# Altium schematic sheet INTERFACES.SchDoc
size A4; SheetNumber: 6; SheetTotal: 6
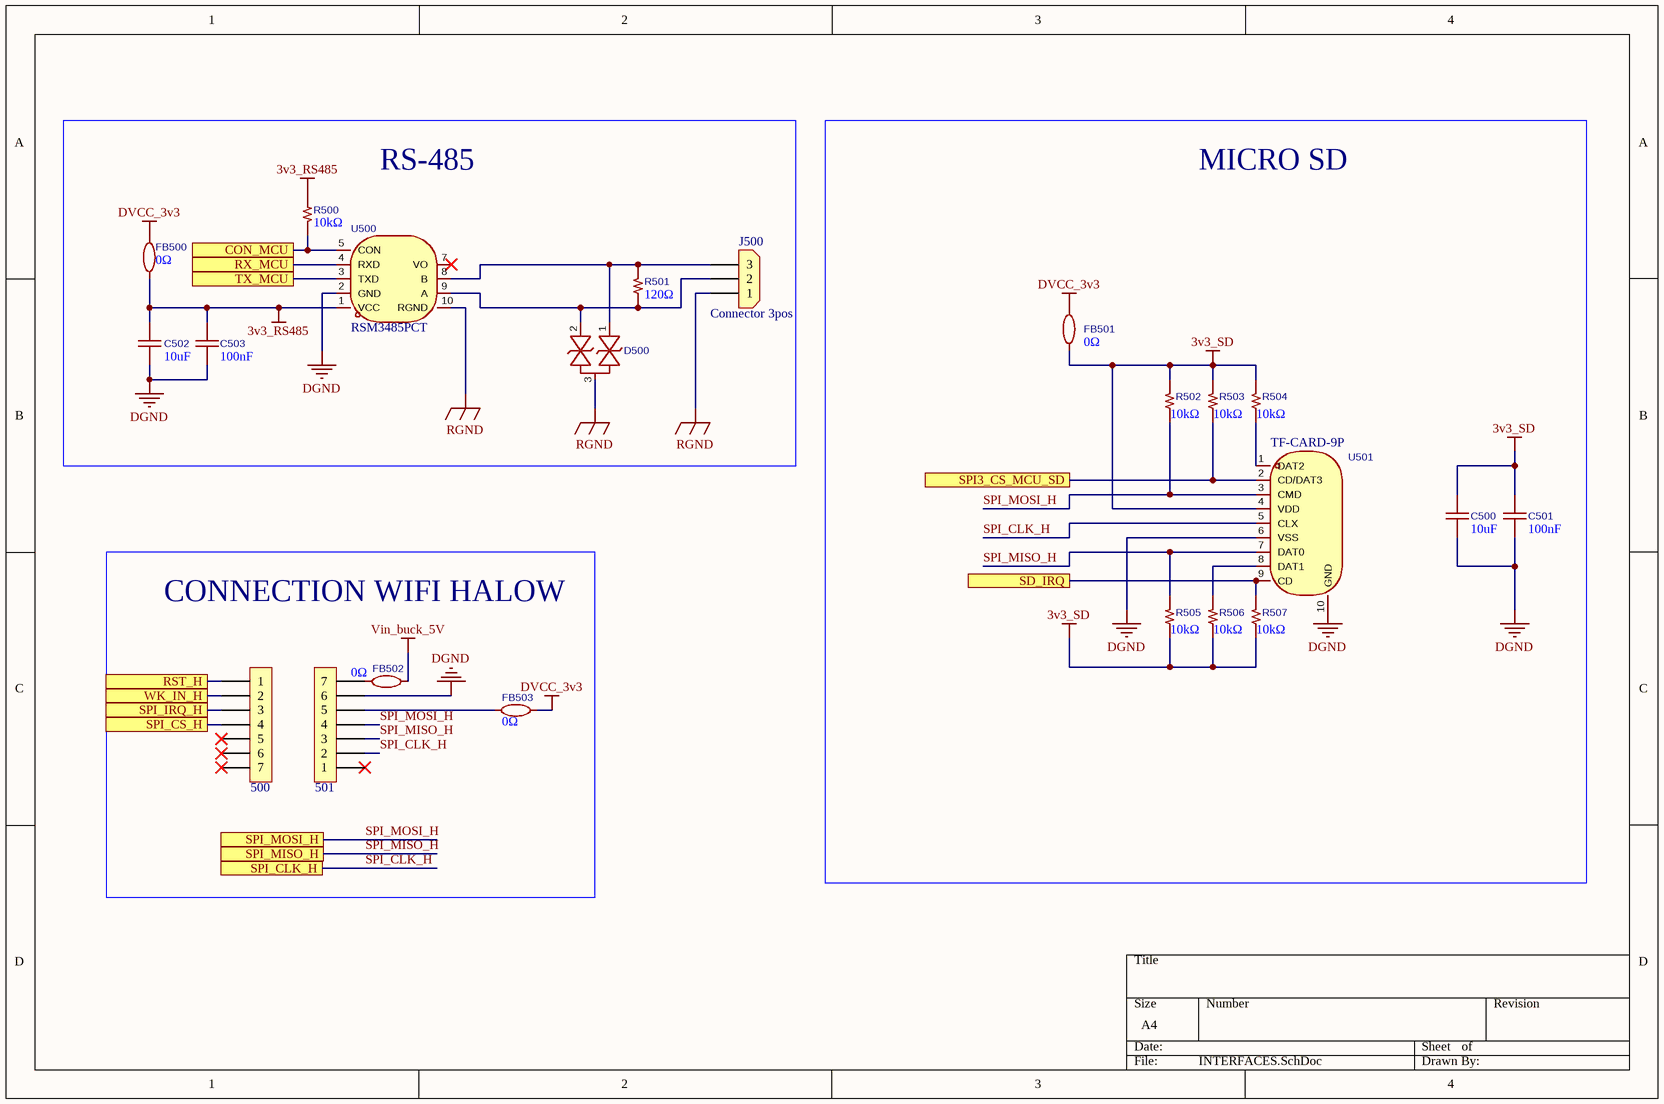
[diagram p0: INTERFACES.SchDoc]

## Parts
500  7x1  [H_7x1_TH_100mil]  (value not drawn)  (no BOM)
501  7x1  [H_7x1_TH_100mil]  (value not drawn)  (no BOM)
C500  value 10uF  [0805_cap]  (hidden comment: muRata GRM21BR61C106KE15L)
C501  value 100nF  [0603_cap]  (hidden comment: AIDE CAPACITOR 0603X7R104K250NT)
C502  value 10uF  [0805_cap]  (hidden comment: muRata GRM21BR61C106KE15L)
C503  value 100nF  [0603_cap]  (hidden comment: AIDE CAPACITOR 0603X7R104K250NT)
D500  C908219  [SOT-23-3_L2.9-W1.3-P1.90-LS2.4-BR]  (value not drawn)
FB500  value 0Ω  [0603_cap]  (hidden comment: Yanchuang SCBM160808U090T)
FB501  value 0Ω  [0603_cap]  (hidden comment: Yanchuang SCBM160808U090T)
FB502  value 0Ω  [0603_cap]  (hidden comment: Yanchuang SCBM160808U090T)
FB503  value 0Ω  [0603_cap]  (hidden comment: Yanchuang SCBM160808U090T)
J500  Connector 3pos  [CON_3x1_TH_5mm]
R500  value 10kΩ  [0603_RES]  (hidden comment: SAE 1RC0603F1002)
R501  value 120Ω  [0603_RES]  (hidden comment: RES 120Ω ±1% 100mW 0603)
R502  value 10kΩ  [0603_RES]  (hidden comment: SAE 1RC0603F1002)
R503  value 10kΩ  [0603_RES]  (hidden comment: SAE 1RC0603F1002)
R504  value 10kΩ  [0603_RES]  (hidden comment: SAE 1RC0603F1002)
R505  value 10kΩ  [0603_RES]  (hidden comment: SAE 1RC0603F1002)
R506  value 10kΩ  [0603_RES]  (hidden comment: SAE 1RC0603F1002)
R507  value 10kΩ  [0603_RES]  (hidden comment: SAE 1RC0603F1002)
U500  rsm3485pct  [COMM-TH_RSM3485PCT]
U501  tf-card-9p  [SIM-SMD_LX_XDFP-0090-012]

## Blocks framed on the sheet
RS-485: C502 C503 D500 FB500 J500 R500 R501 U500
MICRO SD: C500 C501 FB501 R502-R507 U501
CONNECTION WIFI HALOW: 500 501 FB502 FB503

## Ports
CON_MCU (see MAIN[3B], MCU[2B]), RST_H (see MAIN[3B], MCU[2B]), RX_MCU (see MAIN[3B], MCU[2B]), SD_IRQ (see MAIN[3B], MCU[2C]), SPI3_CS_MCU_SD (see MAIN[3C], MCU[3B]), SPI_CLK_H (see MAIN[3B], MCU[2C]), SPI_CS_H (see MAIN[3B], MCU[2C]), SPI_IRQ_H (see MAIN[3C], MCU[2B]), SPI_MISO_H (see MAIN[3B], MCU[3C]), SPI_MOSI_H (see MAIN[3B], MCU[2C]), TX_MCU (see MAIN[3B], MCU[2B]), WK_IN_H (see MAIN[3B], MCU[2B])

## Nets
3v3_RS485: C502.2 C503.2 FB500.1 R500.1 U500.1(VCC)
3v3_SD: C500.2 C501.2 FB501.1 R502.2 R503.2 R504.2 R505.1 R506.1 R507.1 U501.4(VDD)
DGND: 501.6 C500.1 C501.1 C502.1 C503.1 U500.2(GND) U501.6(VSS) U501.10(GND)
DVCC_3v3: FB500.2 FB501.2 FB503.1
RGND: D500.3 J500.1 U500.10(RGND)
Vin_buck_5V: FB502.1
CON_MCU: R500.2 U500.5(CON) ; port CON_MCU
RST_H: 500.1 ; port RST_H
RX_MCU: U500.4(RXD) ; port RX_MCU
SD_IRQ: R507.2 U501.9(CD) ; port SD_IRQ
SPI3_CS_MCU_SD: R503.1 U501.2(CD/DAT3) ; port SPI3_CS_MCU_SD
SPI_CLK_H: 501.2 U501.5(CLX) ; port SPI_CLK_H
SPI_CS_H: 500.4 ; port SPI_CS_H
SPI_IRQ_H: 500.3 ; port SPI_IRQ_H
SPI_MISO_H: 501.3 R505.2 U501.7(DAT0) ; port SPI_MISO_H
SPI_MOSI_H: 501.4 R502.1 U501.3(CMD) ; port SPI_MOSI_H
TX_MCU: U500.3(TXD) ; port TX_MCU
WK_IN_H: 500.2 ; port WK_IN_H
Net501_5: 501.5 FB503.2
Net501_7: 501.7 FB502.2
NetD500_1: D500.1 J500.3 R501.2 U500.8(B)
NetD500_2: D500.2 J500.2 R501.1 U500.9(A)
NetR504_1: R504.1 U501.1(DAT2)
NetR506_2: R506.2 U501.8(DAT1)

Not connected (* = marked no-connect by the designer): 500 5* 6* 7*; 501 1*; U500 7(VO)*

## Library data of the parts
500 501 = H_Male_7x1_TH_100mil: ComponentLink1Description: LCSC
C500 C502 = CAP CER 10uF 16V X5R 0805: ComponentLink1Description: New link; ComponentLink1URL: https://www.lcsc.com/es/product-detail/C77075.html?spm=wm.fly.bg.11.xh___wm.fly.dhl.mly.13-0-3&lcsc_vid=ElBYBFACR1JaVQdSQ1NeBFwHFAdfUFIFEwUNXlwCEVQxVlNfRlVWUFNWT1hWUDtW; Manufacturer 1: muRata; Manufacturer Part Number 1: GRM21BR61C106KE15L; Supplier Part Number 1: C77075; Supplier 1: LCSC
C501 C503 = CAP CER 100nF 25V X7R 0603: ComponentLink1Description: LCSC; ComponentLink1URL: https://www.lcsc.com/product-detail/C465156.html?s_z=n_q_HGC0603G0150J500NTHJ; Supplier 1: LCSC; Manufacturer 1: AIDE CAPACITOR; Manufacturer Part Number 1: 0603X7R104K250NT; Supplier Part Number 1: C48579280
D500 = sm712_c908219_RS485: Polarity:Bidirectional Reverse Stand-Off Voltage (Vrwm):7V Clamping Voltage:20V Peak Pulse Current (Ipp):18A Peak Pulse Power Dissipation (Ppp):360W Voltage - Breakdown:13.3V Reverse Leakage Current (Ir):1uA Number of Channels:2 Operating Temperature:-55℃; Manufacturer 1: FUXINSEMI; Manufacturer Part Number 1: SM712; ComponentLink1Description: New link; ComponentLink1URL: https://www.lcsc.com/es/product-detail/C908219.html?s_z=n_q_p_sm712_c908219&spm=wm.ssy.bg.0.xh&lcsc_vid=FFRdVwAETgNbVwAHTlRdV1UFEwcIU1ZXQVZZAlYFQAcxVlNfRlJdUlJTQlRWXjsOAxUeFF5JWBYZEEoKFBINSQcJGk4LFEsWBQ4KEgcSWgULEwUPG04tVVZVT1BdXlVIHxUDCw%3D%3D; Supplier Part Number 1: C908219; Supplier 1: LCSC
FB500-FB503 = FERR_10mohms 15o@100MHz: 10mΩ 15Ω@100MHz 0603 Ferrite Beads and Chips; ComponentLink1Description: LCSC; ComponentLink1URL: https://www.lcsc.com/es/product-detail/C52205324.html?s_z=s_c_Ferrite%2520Beads%2520and%2520Chips&spm=wm.fly.bg.0.xh&lcsc_vid=T1EMUlBeR1ALUlVSFANeUFcFR1BWV1EHFVFaA1dQElAxVlNfRlJaVFNSQlhYUjsOAxUeFF5JWBYZEEoKFBINSQcJGk4LFEsFFhULAAsUDk5fVlNWWQkaCgg%3D; Supplier 1: LCSC; Supplier Part Number 1: C52205324; Manufacturer 1: Yanchuang; Manufacturer Part Number 1: SCBM160808U090T
J500 = Con_3x1_TH_5mm: 1x3P 10A -40℃~+105℃ 300V Green 14~26 Through Hole 5mm 2.5 1 3 Plugin,P=5mm Screw Terminal Blocks ROHS; Manufacturer 1: MAX; Manufacturer Part Number 1: MX126-5.0-03P-GN01-Cu-S-A; Supplier 1: LCSC; Supplier Part Number 1: C5188435; ComponentLink1Description: Digi-Key; ComponentLink1URL: https://lcsc.com/product-detail/Screw-Terminal-Blocks_MAX-MX126-5-0-03P-GN01-Cu-S-A_C5188435.html
R500 R502-R507 = RES_10kohms 100mW 75V: 10kΩ 100mW 75V Thick Film Resistor ±100ppm/℃ ±1% 0603 Chip Resistor - Surface Mount; ComponentLink1Description: New link; ComponentLink1URL: https://www.lcsc.com/es/product-detail/C53224186.html?spm=wm.fly.bg.4.xh___wm.fly.dhl.mly.13-6-1&lcsc_vid=T1EMUlBeR1ALUlVSFANeUFcFR1BWV1EHFVFaA1dQElAxVlNfRlJaV1FUQldbXzsOAxUeFF5JWBYZEEoKFBINSQcJGk4NBhYS; Manufacturer 1: SAE; Manufacturer Part Number 1: 1RC0603F1002; Supplier Part Number 1: C53224186; Supplier 1: LCSC
R501 = RES 120ohms 100mW150V Thick Film Resistor  ±100ppm 0805: Manufacturer 1: HWA CHN; Manufacturer Part Number 1: HRC0805F1200FNTN; ComponentLink1Description: New link; ComponentLink1URL: https://www.lcsc.com/product-detail/C48996813.html; Supplier Part Number 1: C54921099; Supplier 1: LCSC
U500 = RS485_RSM3485PCT: Data Rate:9.6Kbps ESD Protect:Yes Voltage - Supply:3.15V~3.45V Voltage - Supply:3.15V~3.45V isolation:2500V Number of Nodes:64 Quiescent Current:30mA Automatic flow control:No Operating Temperature:-40℃~+85℃ Operating Temperature:-40℃~+85℃; Manufacturer 1: VISOM; ComponentLink1Description: LCSC; ComponentLink1URL: https://www.lcsc.com/es/product-detail/C882105.html?s_z=n_q_RSM3485PCT&spm=wm.fly.bg.0.xh&lcsc_vid=T1EMUlBeR1ALUlVSFANeUFcFR1BWV1EHFVFaA1dQElAxVlNfRlJbVlVWR1RZVzsOAxUeFF5JWBYZEEoKFBINSQcJGk4LFEsFFhULAAsUDk5cUVFIHxUDCw%3D%3D; Supplier 1: LCSC; Supplier Part Number 1: C882105; Manufacturer Part Number 1: RSM3485PCT
U501 = tf-card-9p: Card Connection Mode:Push-Push Card Type:MicroSD Card (TF Card) Connector Type:Connector and Ejector Height Above Board:1.8mm Operating Temperature:-25℃~+90℃ Operating Temperature:-25℃~+90℃; Manufacturer 1: BXCONN; ComponentLink1Description: LCSC; ComponentLink1URL: https://www.lcsc.com/es/product-detail/C53144700.html?s_z=n_q_tf-card-9p&spm=wm.fly.bg.0.xh&lcsc_vid=FFRdVwAETgNbVwAHTlRdV1UFEwcIU1ZXQVZZAlYFQAcxVlNfRlJdUlNWQ1NWXjsOAxUeFF5JWBYZEEoKFBINSQcJGk4LFEsWBQ4KEgcSWgULEwUPG04tXlReRVBXSQwSGg0%3D; Supplier 1: LCSC; Supplier Part Number 1: C53144700; Manufacturer Part Number 1: TF-CARD-9P